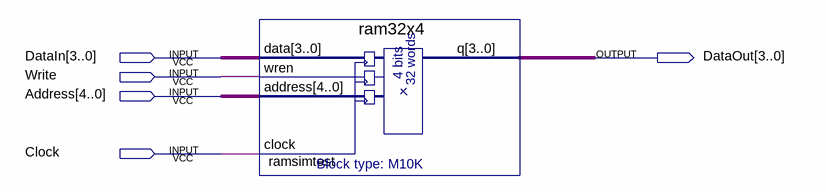
[diagram p0: schematic sheet]
// Quartus schematic MemoryModule.bdf as structural Verilog: 1 symbols, 5 pins
module MemoryModule (
  input  [3:0] DataIn,
  input  Write,
  input  [4:0] Address,
  input  Clock,
  output [3:0] DataOut
);

  ram32x4 ramsimtest (.data(DataIn), .wren(Write), .address(Address), .clock(Clock), .q(DataOut));
endmodule
